# Altium schematic sheet EVT_SYS_CARRIER.SchDoc
size 594 x 420 mm
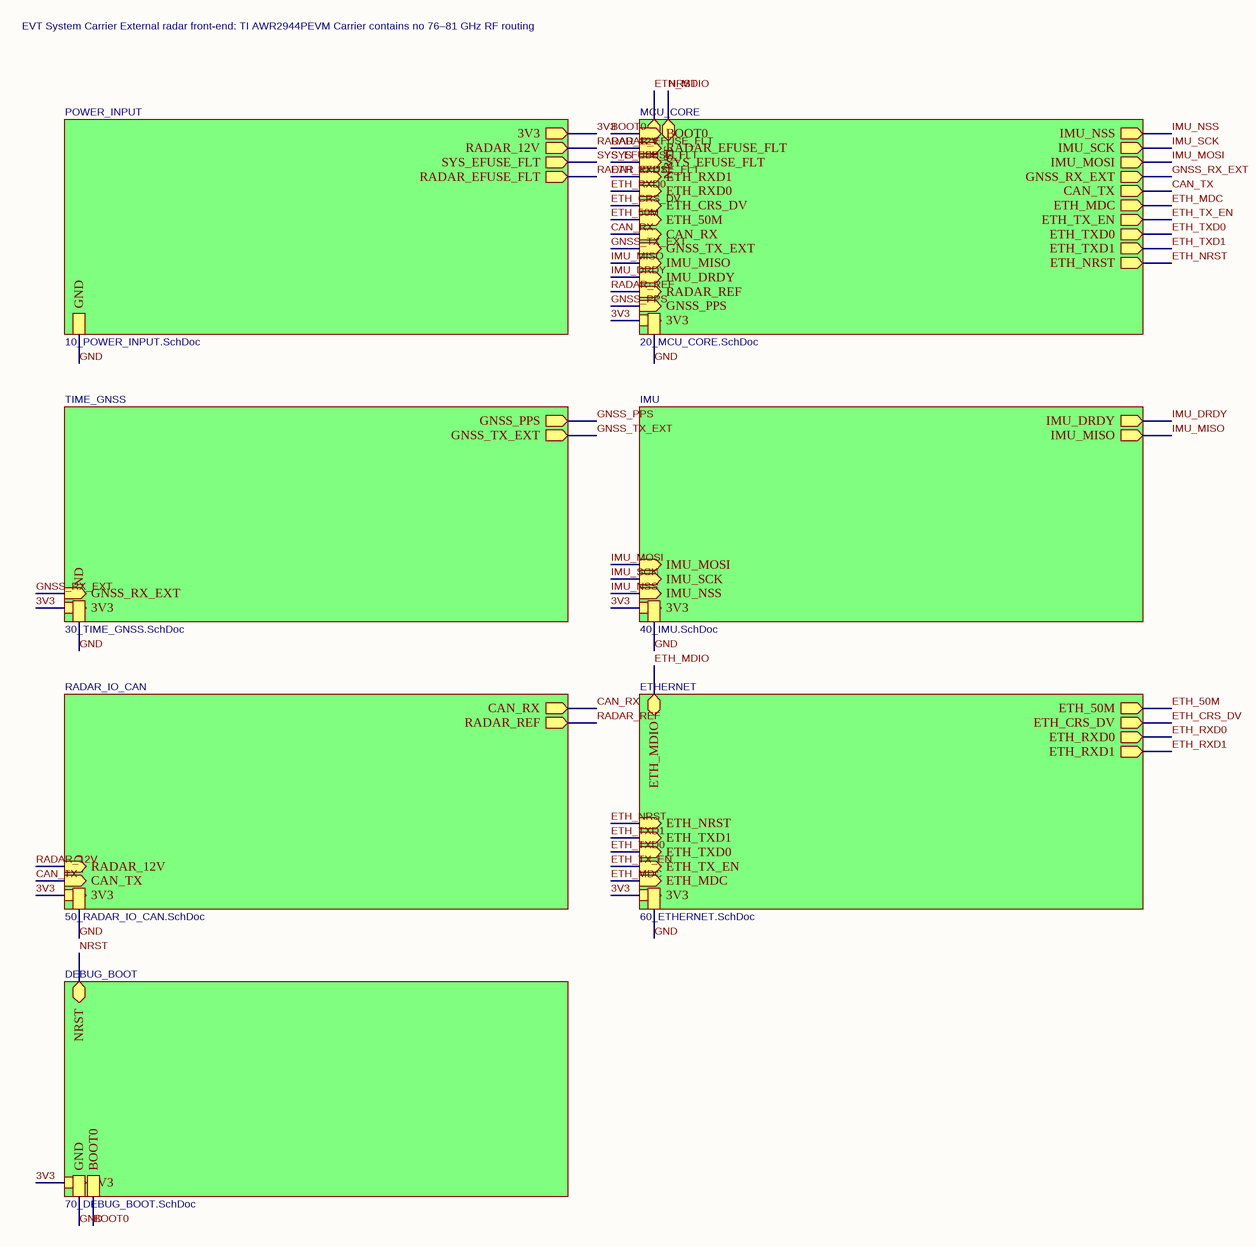
[diagram p0: EVT_SYS_CARRIER.SchDoc]

## Sub-sheets
DEBUG_BOOT = 70_DEBUG_BOOT.SchDoc: 3V3 (in), GND, NRST (bidir), BOOT0
ETHERNET = 60_ETHERNET.SchDoc: 3V3 (in), GND, ETH_50M (out), ETH_MDIO (bidir), ETH_MDC (in), ETH_CRS_DV (out), ETH_RXD0 (out), ETH_RXD1 (out), ETH_TX_EN (in), ETH_TXD0 (in), ETH_TXD1 (in), ETH_NRST (in)
IMU = 40_IMU.SchDoc: 3V3 (in), GND, IMU_DRDY (out), IMU_NSS (in), IMU_SCK (in), IMU_MISO (out), IMU_MOSI (in)
MCU_CORE = 20_MCU_CORE.SchDoc: 3V3 (in), GND, GNSS_PPS (in), RADAR_REF (in), IMU_DRDY (in), IMU_NSS (out), IMU_SCK (out), IMU_MISO (in), IMU_MOSI (out), GNSS_RX_EXT (out), GNSS_TX_EXT (in), CAN_RX (in), CAN_TX (out), ETH_50M (in), ETH_MDIO (bidir), ETH_MDC (out), ETH_CRS_DV (in), ETH_RXD0 (in), ETH_RXD1 (in), ETH_TX_EN (out), ETH_TXD0 (out), ETH_TXD1 (out), ETH_NRST (out), SYS_EFUSE_FLT (in), RADAR_EFUSE_FLT (in), NRST (bidir), BOOT0 (in)
POWER_INPUT = 10_POWER_INPUT.SchDoc: 3V3 (out), RADAR_12V (out), SYS_EFUSE_FLT (out), RADAR_EFUSE_FLT (out), GND
RADAR_IO_CAN = 50_RADAR_IO_CAN.SchDoc: 3V3 (in), GND, CAN_TX (in), CAN_RX (out), RADAR_REF (out), RADAR_12V (in)
TIME_GNSS = 30_TIME_GNSS.SchDoc: 3V3 (in), GND, GNSS_PPS (out), GNSS_TX_EXT (out), GNSS_RX_EXT (in)

## Nets
3V3: sheet POWER_INPUT/3V3, sheet MCU_CORE/3V3, sheet TIME_GNSS/3V3, sheet IMU/3V3, sheet RADAR_IO_CAN/3V3, sheet ETHERNET/3V3, sheet DEBUG_BOOT/3V3
BOOT0: sheet MCU_CORE/BOOT0, sheet DEBUG_BOOT/BOOT0
CAN_RX: sheet MCU_CORE/CAN_RX, sheet RADAR_IO_CAN/CAN_RX
CAN_TX: sheet MCU_CORE/CAN_TX, sheet RADAR_IO_CAN/CAN_TX
ETH_50M: sheet MCU_CORE/ETH_50M, sheet ETHERNET/ETH_50M
ETH_CRS_DV: sheet MCU_CORE/ETH_CRS_DV, sheet ETHERNET/ETH_CRS_DV
ETH_MDC: sheet MCU_CORE/ETH_MDC, sheet ETHERNET/ETH_MDC
ETH_MDIO: sheet MCU_CORE/ETH_MDIO, sheet ETHERNET/ETH_MDIO
ETH_NRST: sheet MCU_CORE/ETH_NRST, sheet ETHERNET/ETH_NRST
ETH_RXD0: sheet MCU_CORE/ETH_RXD0, sheet ETHERNET/ETH_RXD0
ETH_RXD1: sheet MCU_CORE/ETH_RXD1, sheet ETHERNET/ETH_RXD1
ETH_TX_EN: sheet MCU_CORE/ETH_TX_EN, sheet ETHERNET/ETH_TX_EN
ETH_TXD0: sheet MCU_CORE/ETH_TXD0, sheet ETHERNET/ETH_TXD0
ETH_TXD1: sheet MCU_CORE/ETH_TXD1, sheet ETHERNET/ETH_TXD1
GND: sheet POWER_INPUT/GND, sheet MCU_CORE/GND, sheet TIME_GNSS/GND, sheet IMU/GND, sheet RADAR_IO_CAN/GND, sheet ETHERNET/GND, sheet DEBUG_BOOT/GND
GNSS_PPS: sheet MCU_CORE/GNSS_PPS, sheet TIME_GNSS/GNSS_PPS
GNSS_RX_EXT: sheet MCU_CORE/GNSS_RX_EXT, sheet TIME_GNSS/GNSS_RX_EXT
GNSS_TX_EXT: sheet MCU_CORE/GNSS_TX_EXT, sheet TIME_GNSS/GNSS_TX_EXT
IMU_DRDY: sheet MCU_CORE/IMU_DRDY, sheet IMU/IMU_DRDY
IMU_MISO: sheet MCU_CORE/IMU_MISO, sheet IMU/IMU_MISO
IMU_MOSI: sheet MCU_CORE/IMU_MOSI, sheet IMU/IMU_MOSI
IMU_NSS: sheet MCU_CORE/IMU_NSS, sheet IMU/IMU_NSS
IMU_SCK: sheet MCU_CORE/IMU_SCK, sheet IMU/IMU_SCK
NRST: sheet MCU_CORE/NRST, sheet DEBUG_BOOT/NRST
RADAR_12V: sheet POWER_INPUT/RADAR_12V, sheet RADAR_IO_CAN/RADAR_12V
RADAR_EFUSE_FLT: sheet POWER_INPUT/RADAR_EFUSE_FLT, sheet MCU_CORE/RADAR_EFUSE_FLT
RADAR_REF: sheet MCU_CORE/RADAR_REF, sheet RADAR_IO_CAN/RADAR_REF
SYS_EFUSE_FLT: sheet POWER_INPUT/SYS_EFUSE_FLT, sheet MCU_CORE/SYS_EFUSE_FLT

## Notes on the sheet
- EVT System Carrier
  External radar front-end: TI AWR2944PEVM
  Carrier contains no 76–81 GHz RF routing
- 1
- 2
- 3
- 4
- 5
- 6
- 7
- 8
- 9
- 10
- 11
- A
- B
- C
- D
- E
- F
- G
- H
- Title: EVT_SYS_CARRIER
- File: EVT_SYS_CARRIER.kicad_sch
- Sheet: /
- KiCad E.D.A.  kicad (5.1.4)-1
- Size: A2
- Date:
- Rev:
- Id: 1/1